# EasyEDA schematic SCH_LocoNet+ESP+Power_2026-11-13.json
TITLE: LocoNet+ESP+Power; REV: 1.0; Date: 2026-11-10; Sheet: 1/1; Drawn By: dipendersingh302008; Company: hack club
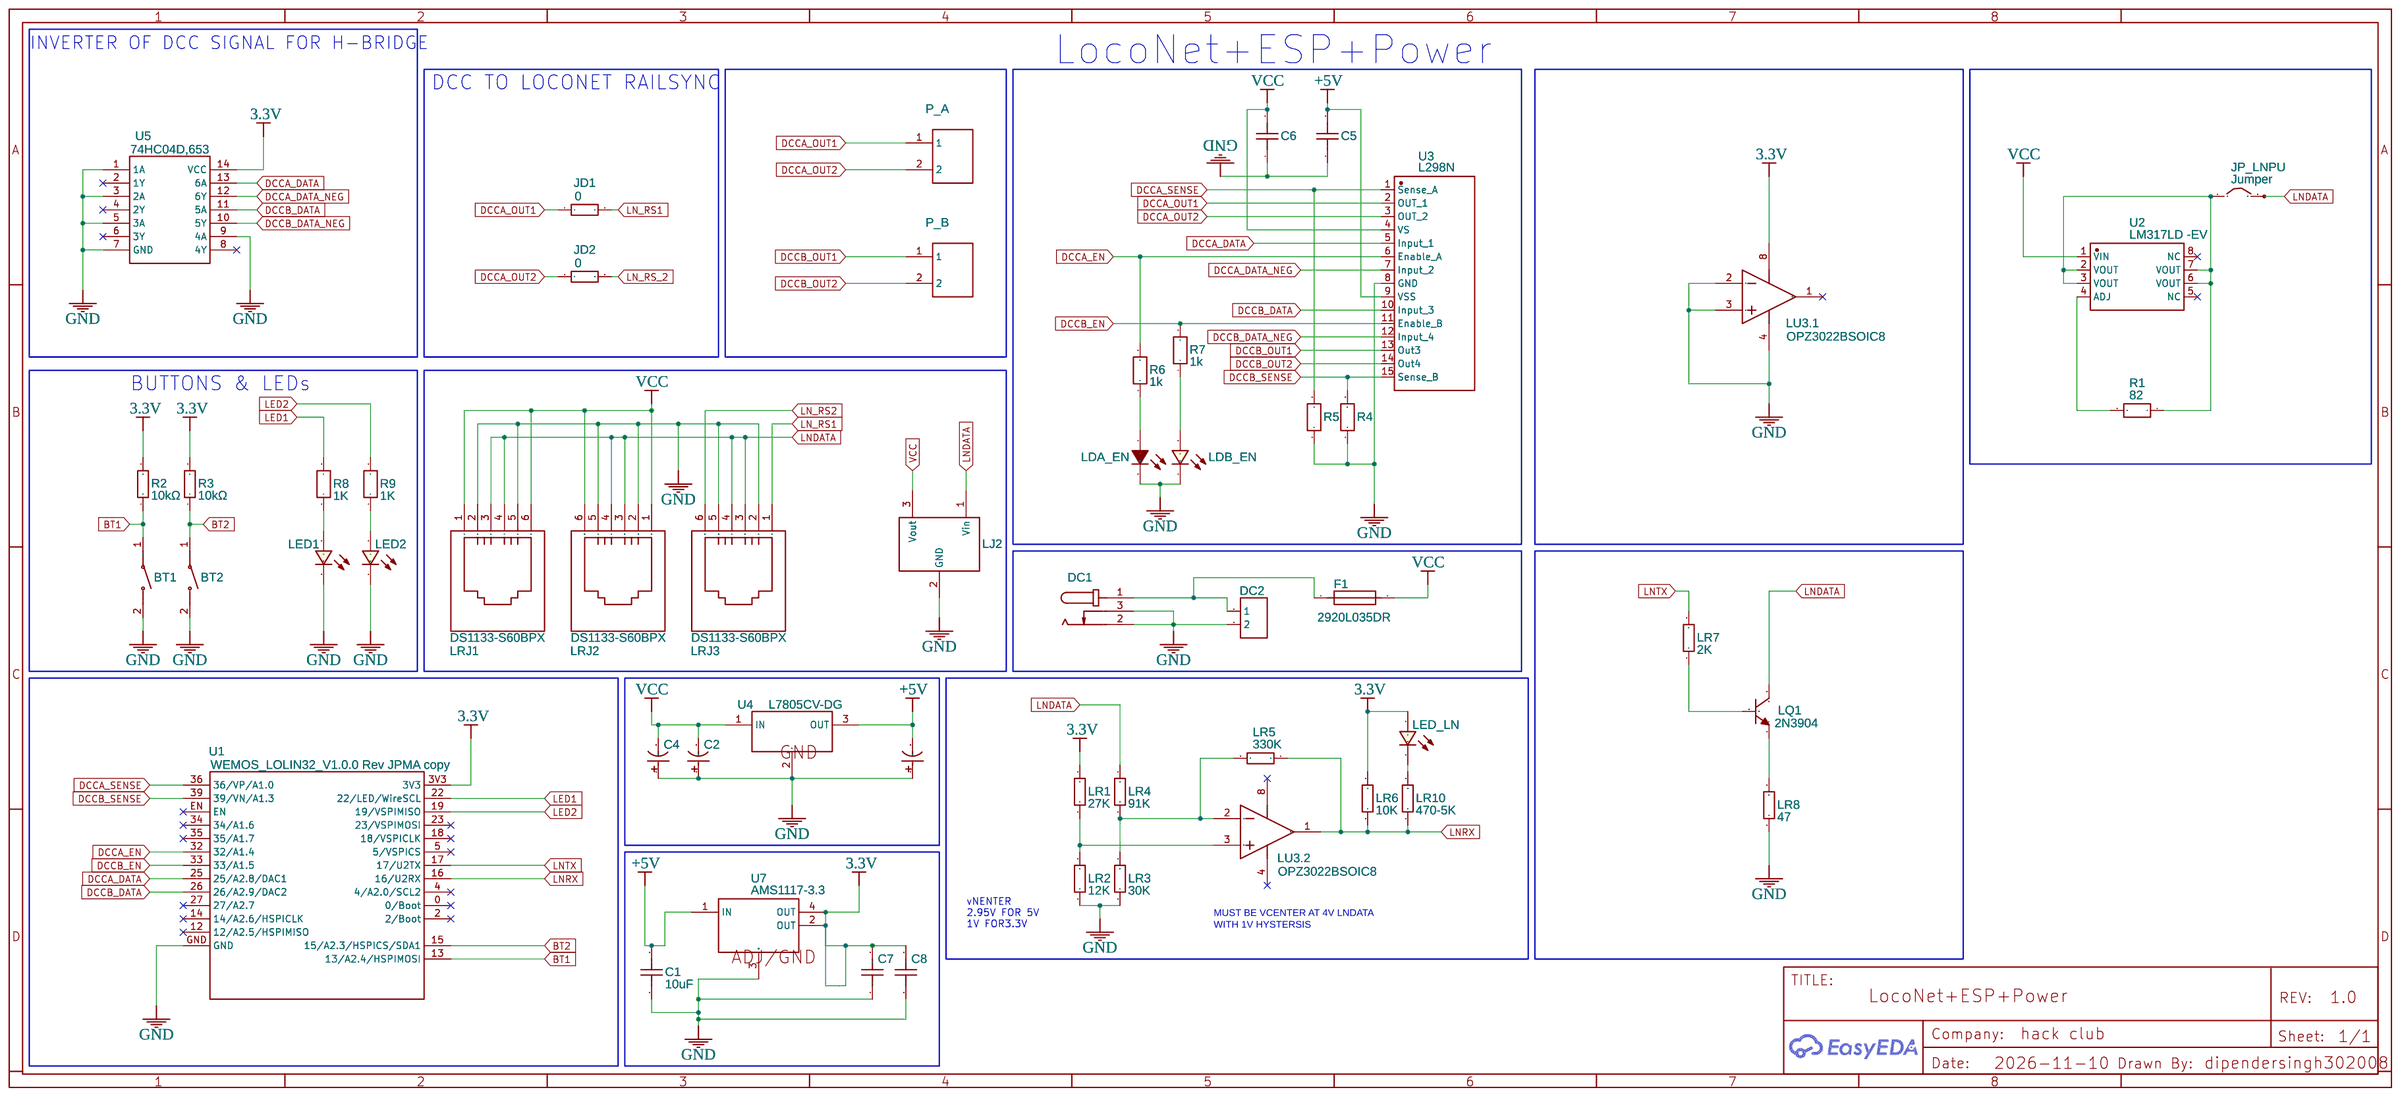
[diagram p0: schematic sheet]

## Parts
BT1  K2-1107ST-A4SW-06  [KEY-SMD_L6.2-W3.6-LS8.0_K2-1107ST-A4SW-06]
BT2  K2-1107ST-A4SW-06  [KEY-SMD_L6.2-W3.6-LS8.0_K2-1107ST-A4SW-06]
C1  10uF  [C0603]
C2  0.33u 25V  [CAP-TH_BD4.0-P1.50-D0.8-FD]
C3  0.1u  [CAP-TH_BD4.0-P1.50-D0.8-FD]
C4  10u 25V  [CAP-TH_BD4.0-P1.50-D0.8-FD]
C5  100nF  [C0603]
C6  100nF  [C0603]
C7  22nF  [C0603]
C8  1uF  [C0603]
DC1  DC005-2.0MM  [DC-IN-TH_DC005-T20]
DC2  CONN-TH_2P-P5.08  [CONN-TH_2P-P5.08]
F1  2920L035DR  [F2920]
JD1  0  [R0603]
JD2  0  [R0603]
JP_LNPU  Jumper  [JUMPER WIRE]
LDA_EN  17-21SURC/S530-A3/TR8  [LED0805-R-RD]
LDB_EN  19-217/R6C-AL1M2VY/3T  [LED0603-RD]
LED1  19-217/R6C-AL1M2VY/3T  [LED0603-RD]
LED2  19-217/R6C-AL1M2VY/3T  [LED0603-RD]
LED_LN  19-217/R6C-AL1M2VY/3T  [LED0603-RD]
LJ2  CJ7805_C77895  [TO-220-3_L10.0-W4.5-P2.54-L]
LQ1  2N3904  [TO-92-3_L5.1-W4.1-P1.27-L]
LR1  27K  [RES-TH_BD2.4-L6.3-P10.30-D0.6]
LR2  12K  [RES-TH_BD2.4-L6.3-P10.30-D0.6]
LR3  30K  [RES-TH_BD2.4-L6.3-P10.30-D0.6]
LR4  91K  [RES-TH_BD2.4-L6.3-P10.30-D0.6]
LR5  330K  [RES-TH_BD2.4-L6.3-P10.30-D0.6]
LR6  10K  [RES-TH_BD2.4-L6.3-P10.30-D0.6]
LR7  2K  [RES-TH_BD2.4-L6.3-P10.30-D0.6]
LR8  47  [RES-TH_BD2.4-L6.3-P10.30-D0.6]
LR10  470-5K  [RES-TH_BD2.4-L6.3-P10.30-D0.6]
LRJ1  DS1133-S60BPX  [RJ11-TH_DS1133-S60BPX]
LRJ2  DS1133-S60BPX  [RJ11-TH_DS1133-S60BPX]
LRJ3  DS1133-S60BPX  [RJ11-TH_DS1133-S60BPX]
LU3  OPZ3022BSOIC8  [SOIC-8_L4.9-W3.9-P1.27-LS6.1-BL]  (sections 1,2)
P_A  CONN-TH_2P-P5.08  [CONN-TH_2P-P5.08]
P_B  CONN-TH_2P-P5.08  [CONN-TH_2P-P5.08]
R1  82  [AXIAL-0.8]
R2  10kΩ  [R0603]
R3  10kΩ  [R0603]
R4  10 1W  [AXIAL-0.8]
R5  0.5 2W  [AXIAL-0.8]
R6  1k  [AXIAL-0.8]
R7  1k  [AXIAL-0.8]
R8  1K  [AXIAL-0.8]
R9  1K  [AXIAL-0.8]
U1  WEMOS_LOLIN32_V1.0.0 Rev JPMA copy  [WEMOS LOLIN32 LITE V1.0.0 UC]
U2  LM317LD -EV  [SOIC-8_L5.0-W4.0-P1.27-LS6.0-BL]
U3  L298N  [MULTIWATT-15_L19.6-W5.0-P1.27-L]
U4  L7805CV-DG  [TO-220-3_L10.0-W4.5-P2.54-L]
U5  74HC04D,653  [SOIC-14_L8.7-W3.9-P1.27-LS6.0-BL]
U7  AMS1117-3.3  [AMS11173.3V]

## Library data of the parts
BT1 BT2 = K2-1107ST-A4SW-06: Contributor: LCSC; Supplier: LCSC; Supplier Part: C118141; Manufacturer: 韩国韩荣; Manufacturer Part: K2-1107ST-A4DW-06; JLCPCB Part Class: Extended Part
C1 = FCC0603X106K350CT: Supplier: LCSC; Supplier Part: C54938430; Manufacturer: FOJAN(富捷); JLCPCB Part Class: Extended Part; Contributor: lcsc
C2-C4 = 10uF 25V 4*7: Supplier: LCSC; Manufacturer: Chengx(承兴); Manufacturer Part: KS106M025C07RR0VH2FP0; Supplier Part: C43351; JLCPCB Part Class: Extended Part
C5 C6 = C0603B104J100NT: Supplier: LCSC; Supplier Part: C17702745; Manufacturer: TORCH(火炬); Contributor: lcsc; JLCPCB Part Class: Extended Part
C7 = C0603C223K5RAC3121: Contributor: LCSC; Supplier: LCSC; Supplier Part: C599708; Manufacturer: KEMET(基美); JLCPCB Part Class: Extended Part
C8 = C0603X105K4RAC7867: Contributor: LCSC; Supplier: LCSC; Supplier Part: C599813; Manufacturer: KEMET(基美); JLCPCB Part Class: Extended Part
DC1 = DC005-2.0MM: Supplier: LCSC; Manufacturer: SOFNG(硕方); Manufacturer Part: DC005-T20; Supplier Part: C111567; JLCPCB Part Class: Extended Part
DC2 = CONN-TH_2P-P5.08: Supplier: LCSC; Contributor: yrikz
F1 = 2920L035DR: Supplier: LCSC; Supplier Part: C27390824; Manufacturer: null; Contributor: lcsc; JLCPCB Part Class: Extended Part
JD1 JD2 = PTFR0603B243RN9: Contributor: LCSC; Supplier: LCSC; Supplier Part: C2892105; Manufacturer: null; JLCPCB Part Class: Extended Part
JP_LNPU = Jumper: Supplier Part: NONE; Manufacturer: NONE; Manufacturer Part: NONE; Contributor: Brocere_PCBLayout
LDA_EN = 17-21SURC/S530-A3/TR8: Supplier: LCSC; Manufacturer: EVERLIGHT(亿光); Supplier Part: C72037; JLCPCB Part Class: Extended Part
LDB_EN LED1 LED2 LED_LN = 19-217/R6C-AL1M2VY/3T: Supplier: LCSC; Manufacturer: EVERLIGHT(亿光); Supplier Part: C72044; JLCPCB Part Class: Extended Part
LJ2 = CJ7805_C77895: Supplier: LCSC; Manufacturer: CJ(江苏长电/长晶); Manufacturer Part: CJ7805; Supplier Part: C77895; JLCPCB Part Class: Extended Part
LQ1 = 2N3904: Supplier: LCSC; Manufacturer: ST(先科); Supplier Part: C118538; JLCPCB Part Class: Extended Part
LR1-LR8 LR10 = MFR50SDRD52-5K: Contributor: lcsc; Supplier: LCSC; Supplier Part: C1755304; Manufacturer: YAGEO(国巨)
LRJ1-LRJ3 = DS1133-S60BPX: Supplier: LCSC; Manufacturer: CONNFLY; Supplier Part: C77859; JLCPCB Part Class: Extended Part
LU3 = OPZ3022BSOIC8: Supplier: LCSC; Supplier Part: C5359437; Manufacturer: analogysemi(类比半导体); subpart_no: 1; JLCPCB Part Class: Extended Part
P_A P_B = MKDSN1.5/2-5.08: Supplier: LCSC; Manufacturer: Phoenix Contact(菲尼克斯); Manufacturer Part: 1729128; Supplier Part: C91153; JLCPCB Part Class: Extended Part
R1 R4-R9 = Res_AXIAL-0.8(2W)_EU
R2 R3 = 0603WAF1002T5E: Supplier: LCSC; Manufacturer: UNI-ROYAL(厚声); Supplier Part: C25804; JLCPCB Part Class: Basic Part
U1 = WEMOS_LOLIN32_V1.0.0 Rev JPMA copy: Contributor: JPMA
U2 = LM317LD -EV: Supplier: LCSC; Supplier Part: C28642195; Manufacturer: null; JLCPCB Part Class: Extended Part; Contributor: lcsc
U3 = L298N: Contributor: LCSC; Supplier: LCSC; Supplier Part: C434589; Manufacturer: HGSEMI(华冠); JLCPCB Part Class: Extended Part
U4 = L7805CV-DG: Supplier: LCSC; Manufacturer: ST(意法半导体); Supplier Part: C3795; JLCPCB Part Class: Extended Part
U5 = 74HC04D,653: Supplier: LCSC; Manufacturer: Nexperia(安世); Supplier Part: C5590; JLCPCB Part Class: Extended Part
U7 = AMS1117-3.3: Contributor: lcsc; Supplier: LCSC; Supplier Part: C2977152; Manufacturer: HGC(深圳汉芯); Manufacturer Part: AMS1117-3.3RG; JLCPCB Part Class: Extended Part

## Nets
3.3V: C7.2 C8.2 LED_LN.2(A) LR1.1 LR6.2 LU3.8(V+) R2.2 R3.2 U1.3V3 U5.14(VCC) U7.2(OUT) U7.4(OUT)
+5V: C1.2 C3.2 C5.2 U3.9(VSS) U4.3(OUT) U7.1(IN)
GND: BT1.2 BT2.2 C1.1 C2.1 C3.1 C4.1 C5.1 C6.1 C7.1 C8.1 DC1.2 DC1.3 DC2.2 LDA_EN.2(C) LDB_EN.1(C) LED1.1(C) LED2.1(C) LJ2.2(GND) LR2.2 LR3.2 LR8.1 LRJ1.2 LRJ1.5 LRJ2.2 LRJ2.5 LRJ3.2 LRJ3.5 LU3.2(-INA) LU3.3(+INA) LU3.4(V-) R4.1 R5.1 U1.GND U3.8(GND) U4.2(GND) U5.1(1A) U5.3(2A) U5.5(3A) U5.7(GND) U5.9(4A) U7.3(ADJ/GND)
VCC: C2.2 C4.2 C6.2 F1.2 LJ2.3(Vout) LRJ1.1 LRJ1.6 LRJ2.1 LRJ2.6 U2.1(VIN) U3.4(VS) U4.1(IN)
BT1: BT1.1 R2.1 U1.13(13/A2.4/HSPIMOSI)
BT2: BT2.1 R3.1 U1.15(15/A2.3/HSPICS/SDA1)
DCCA_DATA: U1.25(25/A2.8/DAC1) U3.5(Input 1) U5.13(6A)
DCCA_DATA_NEG: U3.7(Input 2) U5.12(6Y)
DCCA_EN: R6.2 U1.32(32/A1.4) U3.6(Enable A)
DCCA_OUT1: JD1.1 P_A.1 U3.2(OUT 1)
DCCA_OUT2: JD2.1 P_A.2 U3.3(OUT 2)
DCCA_SENSE: R5.2 U1.36(36/VP/A1.0) U3.1(Sense A)
DCCB_DATA: U1.26(26/A2.9/DAC2) U3.10(Input 3) U5.11(5A)
DCCB_DATA_NEG: U3.12(Input 4) U5.10(5Y)
DCCB_EN: R7.2 U1.33(33/A1.5) U3.11(Enable B)
DCCB_OUT1: P_B.1 U3.13(Out3)
DCCB_OUT2: P_B.2 U3.14(Out4)
DCCB_SENSE: R4.2 U1.39(39/VN/A1.3) U3.15(Sense B)
LED1: R8.2 U1.22(22/LED/WireSCL)
LED2: R9.2 U1.19(19/VSPIMISO)
LN_RS1: JD1.2 LRJ3.1
LN_RS2: LRJ3.6
LN_RS_2: JD2.2
LNDATA: JP_LNPU.2 LJ2.1(Vin) LQ1.3(C) LR4.1 LRJ1.3 LRJ1.4 LRJ2.3 LRJ2.4 LRJ3.3 LRJ3.4
LNRX: LR5.1 LR6.1 LR10.1 LU3.1(OUTA) U1.16(16/U2RX)
LNTX: LR7.2 U1.17(17/U2TX)
Net-(DC1-1): DC1.1 DC2.1 F1.1
Net-(JP_LNPU-1): JP_LNPU.1 R1.1 U2.2(VOUT) U2.3(VOUT) U2.6(VOUT) U2.7(VOUT)
Net-(LDA_EN-1): LDA_EN.1(A) R6.1
Net-(LDB_EN-2): LDB_EN.2(A) R7.1
Net-(LED1-2): LED1.2(A) R8.1
Net-(LED2-2): LED2.2(A) R9.1
Net-(LED_LN-1): LED_LN.1(C) LR10.2
Net-(LQ1-1): LQ1.1(E) LR8.2
Net-(LQ1-2): LQ1.2(B) LR7.1
Net-(LR1-2): LR1.2 LR2.1
Net-(LR3-1): LR3.1 LR4.2 LR5.2
Net-(R1-2): R1.2 U2.4(ADJ)

Not connected (* = marked no-connect by the designer): U1 0(0/Boot)* 2(2/Boot)* 4(4/A2.0/SCL2)* 5(5/VSPICS)* 12(12/A2.5/HSPIMISO)* 14(14/A2.6/HSPICLK)* 18(18/VSPICLK)* 23(23/VSPIMOSI)* 27(27/A2.7)* 34(34/A1.6)* 35(35/A1.7)* EN*; U2 5(NC)* 8(NC)*; U5 2(1Y)* 4(2Y)* 6(3Y)* 8(4Y)*

## Notes on the sheet
- INVERTER OF DCC SIGNAL FOR H-BRIDGE
- LocoNet+ESP+Power
- DCC TO LOCONET RAILSYNC
- BUTTONS & LEDs
- vNENTER
  2.95V FOR 5V
  1V FOR3.3V
- MUST BE VCENTER AT 4V LNDATA
  WITH 1V HYSTERSIS
